# Altium schematic sheet POWER.SchDoc: POWER_USB
size A4; Revision: V2.0; SheetNumber: 4; SheetTotal: 7; Project: PY32F403v1xT_START
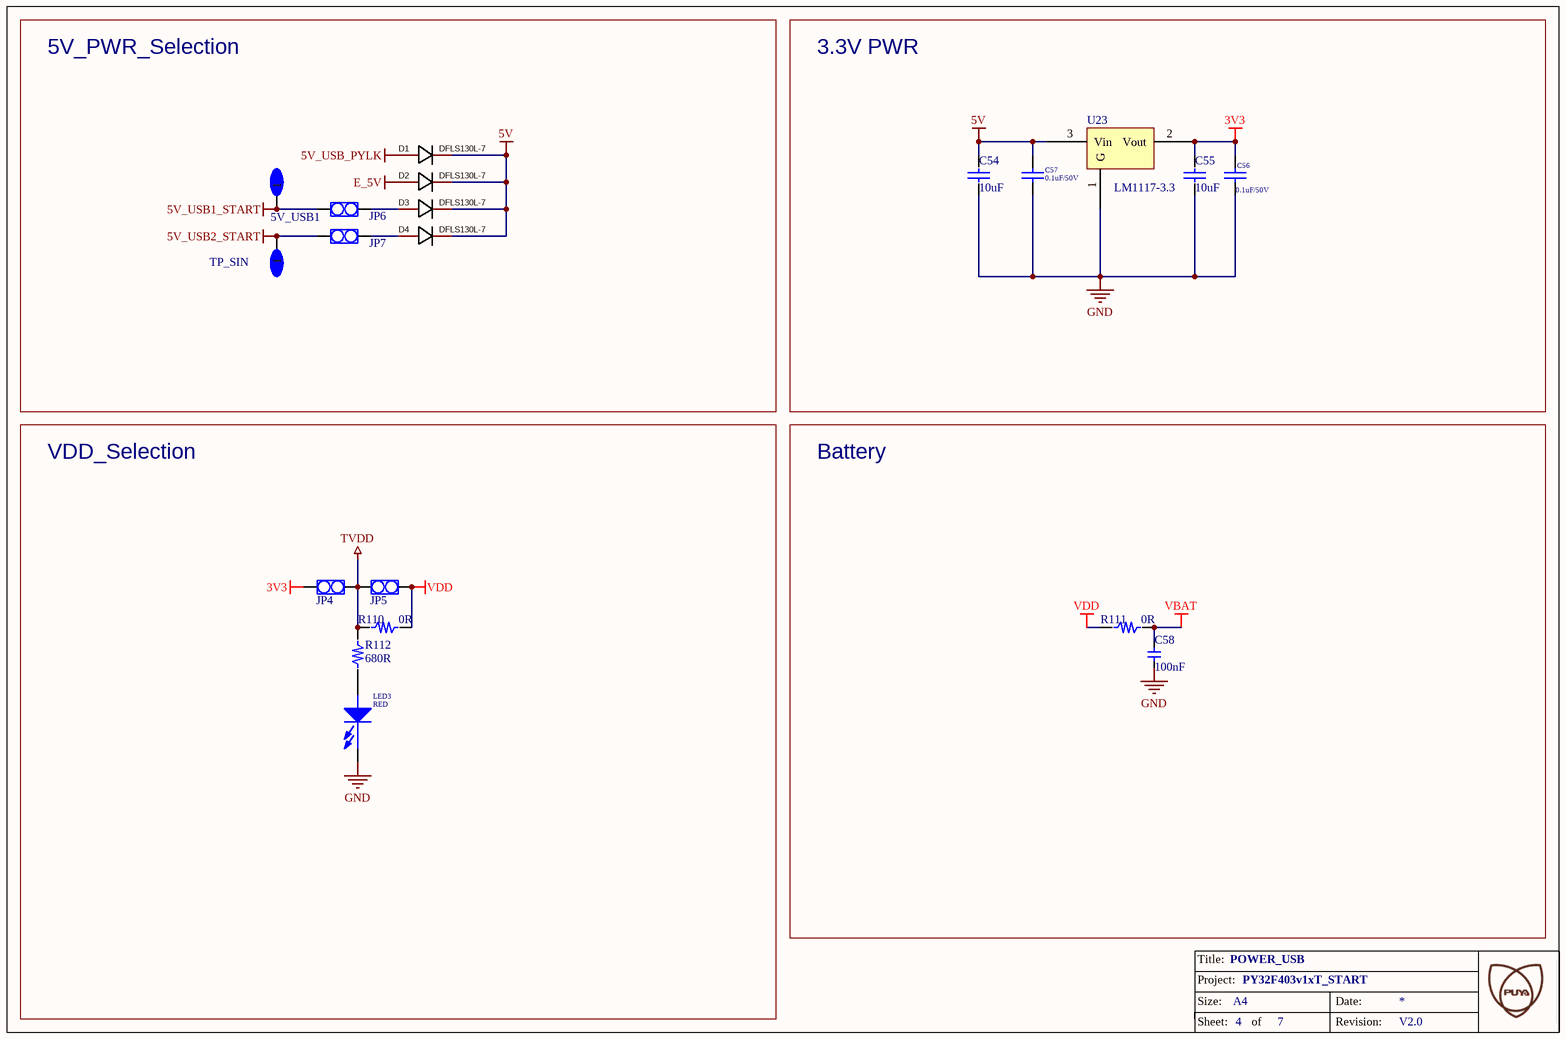
[diagram p0: POWER.SchDoc]

## Parts
5V_USB1  TP_SIN  [TP_SIN]  (value not drawn)
5V_USB2  TP_SIN  [TP_SIN]
C54  10uF  [C0805]
C55  10uF  [C0805]
C56  0.1uF/50V  [c0603cap]
C57  0.1uF/50V  [c0603cap]
C58  100nF  [C0603]
D1  DFLS130L-7  [POWERDI-123_L2.8-W1.8-LS3.7-RD]
D2  DFLS130L-7  [POWERDI-123_L2.8-W1.8-LS3.7-RD]
D3  DFLS130L-7  [POWERDI-123_L2.8-W1.8-LS3.7-RD]
D4  DFLS130L-7  [POWERDI-123_L2.8-W1.8-LS3.7-RD]
JP4  CON2  [CON2]  (value not drawn)
JP5  CON2/NC  [CON2]  (value not drawn)
JP6  CON2  [CON2]  (value not drawn)
JP7  CON2  [CON2]  (value not drawn)
LED3  RED  [0603_LED]
R110  0R  [R0603]
R111  0R  [R0603]
R112  680R  [R0603]
U23  LM1117-3.3  [LM1117-3.3]

## Blocks framed on the sheet
5V_PWR_Selection: 5V_USB1 5V_USB2 D1-D4 JP6 JP7
3.3V PWR: C54-C57 U23
VDD_Selection: JP4 JP5 LED3 R110 R112
Battery: C58 R111

## Nets
3V3: C55.2 C56.2 JP4.1 U23.2(Vout)
5V: C54.2 C57.2 D1.1 D2.1 D3.1 D4.1 U23.3(Vin)
5V_USB1_START: 5V_USB1.1 JP6.1
5V_USB2_START: 5V_USB2.1 JP7.1
5V_USB_PYLK: D1.2
E_5V: D2.2
GND: C54.1 C55.1 C56.1 C57.1 C58.1 LED3.2(CATHODE) U23.1(G)
TVDD: JP4.2 JP5.1 R110.1 R112.2
VBAT: C58.2 R111.2
VDD: JP5.2 R110.2 R111.1
NetD3_2: D3.2 JP6.2
NetD4_2: D4.2 JP7.2
NetLED3_1: LED3.1(ANODE) R112.1

## Notes on the sheet
- Title:
- Project:
- Size:
- Sheet:
- A4
- of
- Date:
- Revision:

## Library data of the parts
C54 C55 = C0805: PCB DECAL: 0805
C56 = Cap: Capacitor; Published: 8-Jun-2000; Revision: July-2002: Re-released for DXP Platform.; Publisher: Altium Limited; Value: 0.1uF/50V
C57 = CAP: Capacitor; Value: 2.2uF; Published: 8-Jun-2000; Publisher: Altium Limited; LatestRevisionDate: 17-Jul-2002; LatestRevisionNote: Re-released for DXP Platform.; PackageReference: RAD-0.3
C58 = C0603: PCB DECAL: 0603
D1-D4 = DFLS130L-7: Manufacturer: DIODES(美台); Add into BOM: yes; Forward Voltage (Vf@If): 310mV@1A; Reverse Voltage (Vr): 30V; Average Rectified Current (Io): 1A; Name: DFLS130L-7; Symbol: DFLS130L-7; Device: DFLS130L-7; LCSC Part Name: 电压:30V 电流:1A; Supplier Part: C110493; Manufacturer Part: DFLS130L-7; Supplier Footprint: Power-DI-123; JLCPCB Part Class: Extended Part; Datasheet: https://atta.szlcsc.com/upload/public/pdf/source/20170427/1493286393645.pdf; Supplier: LCSC; Convert to PCB: yes
JP4-JP7 = CON2_DIP
LED3 = PDI-E803_Dup1
R110-R112 = R0603: PCB DECAL: 0603